# Altium schematic sheet MD-DAC.SchDoc
size A; SheetNumber: 6; SheetTotal: 8
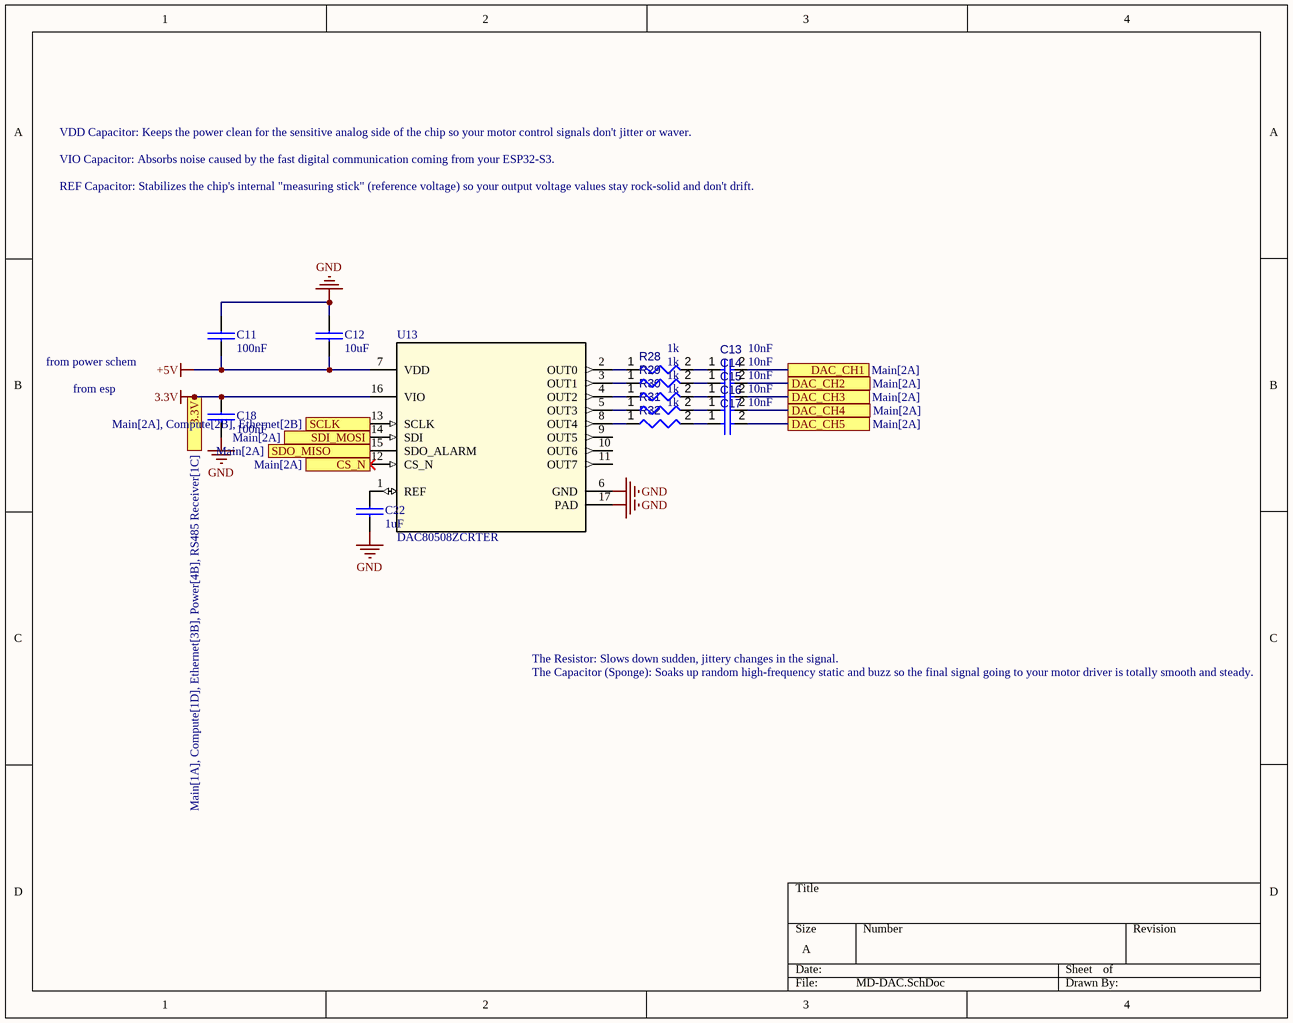
[diagram p0: MD-DAC.SchDoc]

## Parts
C11  value 100nF  [PCC-001-0015-1]  (hidden comment: Capacitor 15uF, 20%, 35V, X5R, 0805)
C12  value 10uF  [PCC-001-0015-1]  (hidden comment: Capacitor 15uF, 20%, 35V, X5R, 0805)
C13  value 10nF  [CAPC0402(1005)60_L]  (hidden comment: Capacitor 10nF +/-20% 50V 0402)
C14  value 10nF  [CAPC0402(1005)60_L]  (hidden comment: Capacitor 10nF +/-20% 50V 0402)
C15  value 10nF  [CAPC0402(1005)60_L]  (hidden comment: Capacitor 10nF +/-20% 50V 0402)
C16  value 10nF  [CAPC0402(1005)60_L]  (hidden comment: Capacitor 10nF +/-20% 50V 0402)
C17  value 10nF  [CAPC0402(1005)60_L]  (hidden comment: Capacitor 10nF +/-20% 50V 0402)
C18  value 100nF  [PCC-001-0015-1]  (hidden comment: Capacitor 15uF, 20%, 35V, X5R, 0805)
C22  value 1uF  [PCC-001-0015-1]  (hidden comment: Capacitor 15uF, 20%, 35V, X5R, 0805)
R28  value 1k  [RESC0402(1005)_L]  (hidden comment: Resistor 1K +/-5 % 0402 63 mW)
R29  value 1k  [RESC0402(1005)_L]  (hidden comment: Resistor 1K +/-5 % 0402 63 mW)
R30  value 1k  [RESC0402(1005)_L]  (hidden comment: Resistor 1K +/-5 % 0402 63 mW)
R31  value 1k  [RESC0402(1005)_L]  (hidden comment: Resistor 1K +/-5 % 0402 63 mW)
R32  value 1k  [RESC0402(1005)_L]  (hidden comment: Resistor 1K +/-5 % 0402 63 mW)
U13  DAC80508ZCRTER  [RTE0016D]

## Ports
3.3V (see Main[1A], Compute[1D], Ethernet[3B], Power[4B], RS485 Receiver[1C]), CS_N (see Main[2A]), DAC_CH1 (see Main[2A]), DAC_CH2 (see Main[2A]), DAC_CH3 (see Main[2A]), DAC_CH4 (see Main[2A]), DAC_CH5 (see Main[2A]), SCLK (see Main[2A], Compute[2B], Ethernet[2B]), SDI_MOSI (see Main[2A]), SDO_MISO (see Main[2A])

## Nets
3.3V: C18.1 U13.16(VIO) ; port 3.3V
+5V: C11.2 C12.2 U13.7(VDD)
GND: C11.1 C12.1 C18.2 C22.2 U13.6(GND) U13.17(PAD)
CS_N: U13.12(CS_N) ; port CS_N
DAC_CH1: C13.2 ; port DAC_CH1
DAC_CH2: C14.2 ; port DAC_CH2
DAC_CH3: C15.2 ; port DAC_CH3
DAC_CH4: C16.2 ; port DAC_CH4
DAC_CH5: C17.2 ; port DAC_CH5
SCLK: U13.13(SCLK) ; port SCLK
SDI_MOSI: U13.14(SDI) ; port SDI_MOSI
SDO_MISO: U13.15(SDO_ALARM) ; port SDO_MISO
NetC13_1: C13.1 R28.2
NetC14_1: C14.1 R29.2
NetC15_1: C15.1 R30.2
NetC16_1: C16.1 R31.2
NetC17_1: C17.1 R32.2
NetC22_1: C22.1 U13.1(REF)
NetR28_1: R28.1 U13.2(OUT0)
NetR29_1: R29.1 U13.3(OUT1)
NetR30_1: R30.1 U13.4(OUT2)
NetR31_1: R31.1 U13.5(OUT3)
NetR32_1: R32.1 U13.8(OUT4)

Not connected (* = marked no-connect by the designer): U13 9(OUT5) 10(OUT6) 11(OUT7)

## Notes on the sheet
- VDD Capacitor: Keeps the power clean for the sensitive analog side of the chip so your motor control signals don't jitter or waver.
- VIO Capacitor: Absorbs noise caused by the fast digital communication coming from your ESP32-S3.
- REF Capacitor: Stabilizes the chip's internal "measuring stick" (reference voltage) so your output voltage values stay rock-solid and don't drift.
- from power schem
- from esp
- The Resistor: Slows down sudden, jittery changes in the signal.
- The Capacitor (Sponge): Soaks up random high-frequency static and buzz so the final signal going to your motor driver is totally smooth and steady.

## Library data of the parts
C11 C12 C18 C22 = Capacitor 15uF, 20%, 35V, X5R, 0805-1: Capacitor, ceramic, 15uF, 20%, 35V, X5R, 0805; Manufacturer Part Number 1: GMC21X5R156M35NT; Manufacturer 1: Cal-Chip Electronics; Manufacturer 2: TDK; Supplier 2: LCSC; Package: 0805; Manufacturer Part Number 2: C2012X5R1V156MT000E; Supplier Part Number 2: C5367448; Tolerance: 20%; Supplier Part Number 1: 4713-GMC21X5R156M35NTCT-ND; Voltage: 35V; Supplier 1: DigiKey; Dielectric: X5R
C13-C17 = CMP-001-00069-3: Chip Capacitor, 10nF +/-20%, 50V, 0402, Thickness 0.6 mm; Tolerance: 5%; Max Operating Temperature: 85°C; Pins: 2; Case/Package: 0402; Voltage Rating: 50V; Min Operating Temperature: -55°C; Mounting Technology: SMT
R28-R32 = CMP-009-00157-3: Chip Resistor, 1 kOhms, +/-5 %, 63 mW, -55 to 155 degC, 0402; Tolerance: 5%; Power: 63mW; Case/Package: 0402; Pins: 2; Min Operating Temperature: -55°C; Max Operating Temperature: 155°C
U13 = CMP-033-000003-1: True 16-bit, 8-channel, SPI, voltage-output DAC with precision internal reference 16-WQFN -40 to 125; Manufacturer_Name: Texas Instruments; RefDes: RefDes; Copyright: Copyright (C) 2026 Ultra Librarian. All rights reserved.; TYPE: TYPE; Datasheet: https://www.ti.com/lit/gpn/dac80508; Design Item ID: DAC80508ZCRTER; Manufacturer_Part_Number: DAC80508ZCRTER; Source: DAC80508ZCRTER.SchLib